# Altium schematic sheet Main.schdoc
size 297 x 209 mm; Symbol: Drawing-Symbol_A4; Company: 嘉立创EDA; Version: V1.0; Page Size: A4; @Project Name: V4.0整合版; @Update Date: 2026-07-27; @Create Date: 2026-07-27; Device: Drawing-Symbol_A4; @Board Name: Board1; @Page Name: P1; @Create Time: 21:20:04; @Page Count: 1; @Page No: 1; @Schematic Name: Schematic1; @Update Time: 21:20:04; @Assembly Variant: Basic; Border: 1; Title Block Position: 3; Size: A4; Width: 1170; Height: 825; Region Start: 1; X Region Count: 6; Y Region Count: 4; Blade Width: 10; Title Block: 0
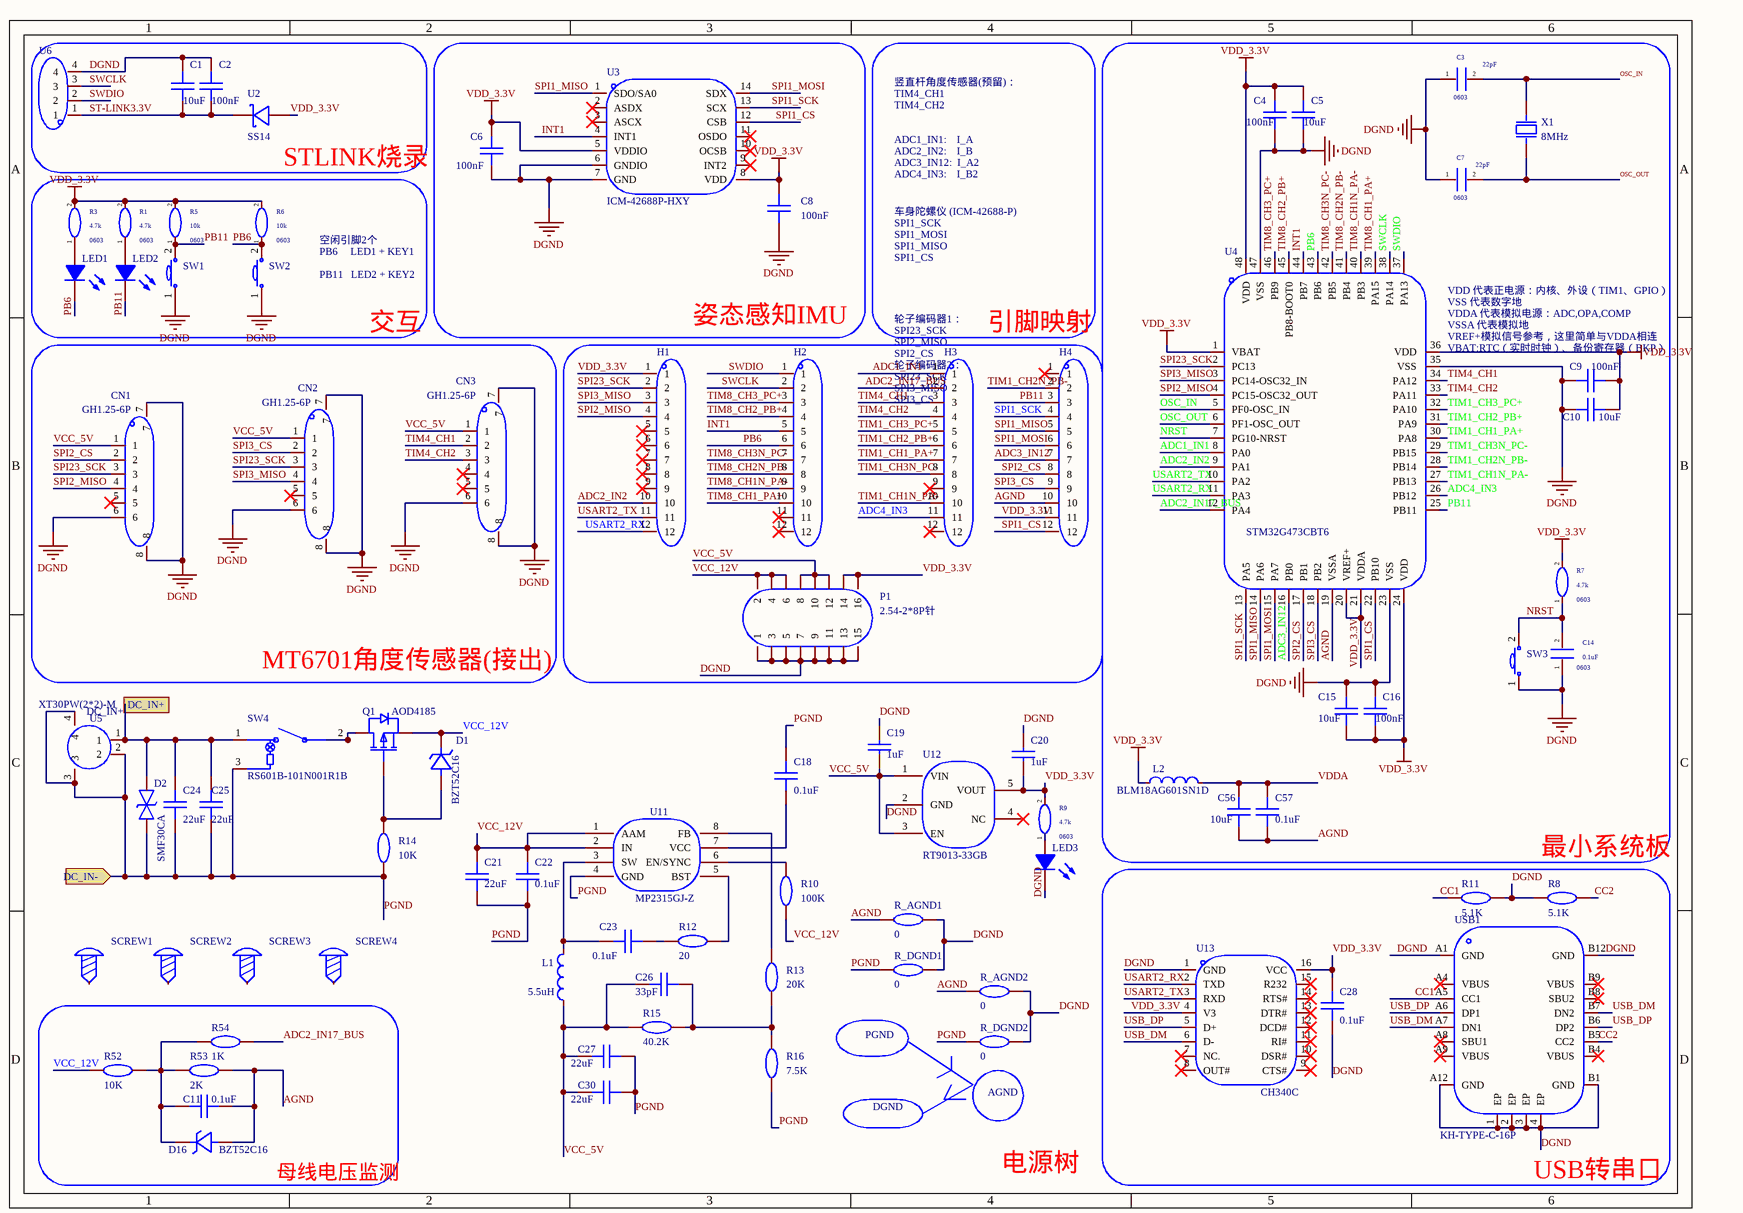
[diagram p0: Main.schdoc]

## Parts
C1  10uF  [C0603]
C2  100nF  [C0603]
C3  value 22pF  Footprint_1: 0603  [C0603]  (hidden comment: My_Library_Cap-0603)
C4  100nF  [C0402]
C5  10uF  [C0402]
C6  100nF  [C0402]
C7  value 22pF  Footprint_1: 0603  [C0603]  (hidden comment: My_Library_Cap-0603)
C8  100nF  [C0402]
C9  100nF  [C0402]
C10  10uF  [C0402]
C11  0.1uF  [C0603]
C14  value 0.1uF  Footprint_1: 0603  [C0603]  (hidden comment: My_Library_Cap-0603)
C15  10uF  [C0402]
C16  100nF  [C0402]
C18  0.1uF  [C0603]
C19  1uF  [C0603]
C20  1uF  [C0603]
C21  22uF  [C0603]
C22  0.1uF  [C0603]
C23  0.1uF  [C0603]
C24  22uF  [C0603]
C25  22uF  [C0603]
C26  33pF  [C0603]
C27  22uF  [C0805]
C28  0.1uF  [C0603]
C30  22uF  [C0805]
C56  10uF  [C0603]
C57  0.1uF  [C0603]
CN1  GH1.25-6P  [CONN-SMD_GH1.25-6P]
CN2  GH1.25-6P  [CONN-SMD_GH1.25-6P]
CN3  GH1.25-6P  [CONN-SMD_GH1.25-6P]
D1  BZT52C16  [SOD-123_L2.7-W1.6-LS3.7-RD]
D2  SMF30CA  [SOD-123_L2.7-W1.8-LS3.7-BI]
D16  BZT52C16  [SOD-123_L2.7-W1.6-LS3.7-RD]
H1  PZ254V-11-12P  [HDR-TH_12P-P2.54-V-M]  (value not drawn)
H2  PZ254V-11-12P  [HDR-TH_12P-P2.54-V-M]  (value not drawn)
H3  PZ254V-11-12P  [HDR-TH_12P-P2.54-V-M]  (value not drawn)
H4  PZ254V-11-12P  [HDR-TH_12P-P2.54-V-M]  (value not drawn)
L1  5.5uH  [IND-SMD_L10.5-W10.2-HSB-1050]
L2  BLM18AG601SN1D  [L0603]
LED1  (no value)  [LED_0603]
LED2  (no value)  [LED_0603]
LED3  (no value)  [LED_0603]
P1  2.54-2*8P针  [HDR-TH_16P-P2.54-V-M-R2-C8-S2.54]
Q1  AOD4185  [TO-252-2_L6.6-W6.1-P4.57-LS9.9-BR-CW]
R1  value 4.7k  Footprint_1: 0603  [R0603]  (hidden comment: My_Library_Res-0603)
R3  value 4.7k  Footprint_1: 0603  [R0603]  (hidden comment: My_Library_Res-0603)
R5  value 10k  Footprint_1: 0603  [R0603]  (hidden comment: My_Library_Res-0603)
R6  value 10k  Footprint_1: 0603  [R0603]  (hidden comment: My_Library_Res-0603)
R7  value 4.7k  Footprint_1: 0603  [R0603]  (hidden comment: My_Library_Res-0603)
R8  5.1K  [R0603]
R9  value 4.7k  Footprint_1: 0603  [R0603]  (hidden comment: My_Library_Res-0603)
R10  100K  [R0603]
R11  5.1K  [R0603]
R12  20  [R0603]
R13  20K  [R0603]
R14  10K  [R0603]
R15  40.2K  [R0603]
R16  7.5K  [R0603]
R52  10K  [R0603]
R53  2K  [R0603]
R54  1K  [R0603]
R_AGND1  0  [R0603]
R_AGND2  0  [R0603]
R_DGND1  0  [R0603]
R_DGND2  0  [R0603]
SCREW1  (no value)  [M2螺丝]
SCREW2  (no value)  [M2螺丝]
SCREW3  (no value)  [M2螺丝]
SCREW4  (no value)  [M2螺丝]
SW1  (no value)  [Key_SMD_3x4x2]
SW2  (no value)  [Key_SMD_3x4x2]
SW3  (no value)  [Key_SMD_3x4x2]
SW4  RS601B-101N001R1B  [SW-TH_RS601B-101N011R1B]
U2  SS14  [SOD-323_L1.7-W1.3-LS2.5-RD]
U3  ICM-42688P-HXY  [LGA-14_L3.0-W2.5-P0.50-TL]
U4  STM32G473CBT6  [LQFP-48_L7.0-W7.0-P0.50-LS9.0-BL]
U5  XT30PW(2*2)-M  [CONN-TH_XT30PW-M]
U6  HX PZ2.54-1x4P WZ  [HDR-TH_4P-P2.54-H-M-W10.3]  (value not drawn)
U11  MP2315GJ-Z  [TSOT-23-8_L2.9-W1.6-P0.65-LS2.8-BR]
U12  RT9013-33GB  [SOT-23-5_L3.0-W1.7-P0.95-LS2.8-BL]
U13  CH340C  [SOP-16_L10.0-W3.9-P1.27-LS6.0-BL]
USB1  KH-TYPE-C-16P  [USB-C-SMD_KH-TYPE-C-16P]
X1  8MHz  [CRYSTAL-SMD_L11.5-W4.8-LS12.7]

## Blocks framed on the sheet
STLINK烧录: C1 C2 U2 U6
姿态感知IMU: C6 C8 U3
最小系统板: C3-C5 C7 C9 C10 C14-C16 C56 C57 L2 R7 SW3 U4 X1
交互: LED1 LED2 R1 R3 R5 R6 SW1 SW2
MT6701角度传感器(接出): CN1-CN3
引脚映射: H1-H4 P1
母线电压监测: C11 D16 R52-R54

## Ports
DC_IN+ (in), DC_IN- (in)

## Nets
DGND: C1.2 C2.2 C3.1 C4.1 C5.1 C6.1 C7.1 C8.1 C9.1 C10.1 C14.1 C15.1 C16.1 C19.2 C20.2 C28.2 CN1.6 CN1.7 CN1.8 CN2.6 CN2.7 CN2.8 CN3.6 CN3.7 CN3.8 LED3.1(C) P1.1 P1.3 P1.5 P1.7 P1.9 P1.11 P1.13 P1.15 R8.1 R11.2 R_AGND1.2 R_AGND2.2 R_DGND1.2 R_DGND2.2 SW1.1 SW2.1 SW3.1 U3.6(GNDIO) U3.7(GND) U4.23(VSS) U4.35(VSS) U4.47(VSS) U6.4 U12.2(GND) U13.1(GND) USB1.1(EP) USB1.2(EP) USB1.3(EP) USB1.4(EP) USB1.A1(GND) USB1.A12(GND) USB1.B1(GND) USB1.B12(GND)
VDD_3.3V: C4.2 C5.2 C6.2 C8.2 C9.2 C10.2 C15.2 C16.2 C20.1 C28.1 H1.1 H4.11 L2.1 P1.14 P1.16 R1.2 R3.2 R5.2 R6.2 R7.2 R9.2 U2.2(A) U3.5(VDDIO) U3.8(VDD) U4.1(VBAT) U4.20(VREF+) U4.21(VDDA) U4.24(VDD) U4.36(VDD) U4.48(VDD) U12.5(VOUT) U13.4(V3) U13.16(VCC)
ADC1_IN1: H3.1 U4.8(PA0)
ADC2_IN2: H1.10 U4.9(PA1)
ADC2_IN17_BUS: H3.2 R54.1 U4.12(PA4)
ADC3_IN12: H4.7 U4.16(PB0)
ADC4_IN3: H3.11 U4.26(PB12)
AGND: C11.2 C56.2 C57.2 D16.2(A) H4.10 R53.1 R_AGND1.1 R_AGND2.1 U4.19(VSSA)
CC1: R11.1 USB1.A5(CC1)
CC2: R8.2 USB1.B5(CC2)
DC_IN+: C24.2 C25.2 D2.2 SW4.1 U5.1
INT1: H2.5 U3.4(INT1) U4.44(PB7)
NRST: C14.2 R7.1 SW3.2 U4.7(PG10-NRST)
OSC_IN: C3.2 U4.5(PF0-OSC_IN) X1.1(OSC1)
OSC_OUT: C7.2 U4.6(PF1-OSC_OUT) X1.2(OSC2)
PB6: H2.6 LED1.1(C) R6.1 SW2.2 U4.43(PB6)
PB11: H4.3 LED2.1(C) R5.1 SW1.2 U4.25(PB11)
PGND: C18.1 C21.1 C22.1 C24.1 C25.1 C27.2 C30.2 D2.1 R14.1 R16.1 R_DGND1.1 R_DGND2.1 SW4.3 U5.2 U5.3 U5.4 U11.4(GND) ; port DC_IN-
SPI1_CS: H4.12 U3.12(CSB) U4.22(PB10)
SPI1_MISO: H4.5 U3.1(SDO/SA0) U4.14(PA6)
SPI1_MOSI: H4.6 U3.14(SDX) U4.15(PA7)
SPI1_SCK: H4.4 U3.13(SCX) U4.13(PA5)
SPI2_CS: CN1.2 H4.8 U4.17(PB1)
SPI2_MISO: CN1.4 H1.4 U4.4(PC15-OSC32_OUT)
SPI3_CS: CN2.2 H4.9 U4.18(PB2)
SPI3_MISO: CN2.4 H1.3 U4.3(PC14-OSC32_IN)
SPI23_SCK: CN1.3 CN2.3 H1.2 U4.2(PC13)
ST-LINK3.3V: C1.1 C2.1 U2.1(K) U6.1
SWCLK: H2.2 U4.38(PA14) U6.3
SWDIO: H2.1 U4.37(PA13) U6.2
TIM1_CH1_PA+: H3.7 U4.30(PA8)
TIM1_CH1N_PA-: H3.10 U4.27(PB13)
TIM1_CH2_PB+: H3.6 U4.31(PA9)
TIM1_CH2N_PB-: H4.2 U4.28(PB14)
TIM1_CH3_PC+: H3.5 U4.32(PA10)
TIM1_CH3N_PC-: H3.8 U4.29(PB15)
TIM4_CH1: CN3.2 H3.3 U4.34(PA12)
TIM4_CH2: CN3.3 H3.4 U4.33(PA11)
TIM8_CH1_PA+: H2.10 U4.39(PA15)
TIM8_CH1N_PA-: H2.9 U4.40(PB3)
TIM8_CH2_PB+: H2.4 U4.45(PB8-BOOT0)
TIM8_CH2N_PB-: H2.8 U4.41(PB4)
TIM8_CH3_PC+: H2.3 U4.46(PB9)
TIM8_CH3N_PC-: H2.7 U4.42(PB5)
USART2_RX: H1.12 U4.11(PA3) U13.2(TXD)
USART2_TX: H1.11 U4.10(PA2) U13.3(RXD)
USB_DM: U13.6(D-) USB1.A7(DN1) USB1.B7(DN2)
USB_DP: U13.5(D+) USB1.A6(DP1) USB1.B6(DP2)
VCC_5V: C19.1 C26.1 C27.1 C30.1 CN1.1 CN2.1 CN3.1 L1.1 P1.8 P1.10 P1.12 R15.2 U12.1(VIN) U12.3(EN)
VCC_12V: C21.2 C22.2 D1.1(K) P1.2 P1.4 P1.6 Q1.3(S) R10.2 R52.2 U11.1(AAM) U11.2(IN)
VDDA: C56.1 C57.1 L2.2
NetC11_1: C11.1 D16.1(K) R52.1 R53.2 R54.2
NetC18_2: C18.2 U11.7(VCC)
NetC23_1: C23.1 L1.2 U11.3(SW)
NetC23_2: C23.2 R12.1
NetC26_2: C26.2 R13.1 R15.1 R16.2
NetD1_2: D1.2(A) Q1.1(G) R14.2
NetLED1_2: LED1.2(A) R3.1
NetLED2_2: LED2.2(A) R1.1
NetLED3_2: LED3.2(A) R9.1
NetQ1_2: Q1.2(D) SW4.2
NetR10_1: R10.1 U11.6(EN/SYNC)
NetR12_2: R12.2 U11.5(BST)
NetR13_2: R13.2 U11.8(FB)

Not connected (* = marked no-connect by the designer): CN1 5*; CN2 5*; CN3 4* 5*; H1 5* 6* 7* 8* 9*; H2 11* 12*; H3 9* 12*; H4 1*; SCREW1 1; SCREW2 1; SCREW3 1; SCREW4 1; U3 2(ASDX)* 3(ASCX)* 9(INT2)* 10(OCSB)* 11(OSDO)*; U12 4(NC)*; U13 7(NC.)* 8(OUT#)* 9(CTS#)* 10(DSR#)* 11(RI#)* 12(DCD#)* 13(DTR#)* 14(RTS#)* 15(R232)*; USB1 A4(VBUS)* A8(SBU1)* A9(VBUS)* B4(VBUS)* B8(SBU2)* B9(VBUS)*

## Notes on the sheet
- 竖直杆角度传感器(预留)：
  TIM4_CH1
  TIM4_CH2
- ADC1_IN1:    I_A
  ADC2_IN2:    I_B
  ADC3_IN12:  I_A2
  ADC4_IN3:    I_B2
- (near H3) 车身陀螺仪 (ICM-42688-P)
  SPI1_SCK
  SPI1_MOSI
  SPI1_MISO
  SPI1_CS
- 空闲引脚2个
  PB6     LED1 + KEY1
  PB11   LED2 + KEY2
- VDD 代表正电源：内核、外设（TIM1、GPIO）
  VSS 代表数字地
  VDDA 代表模拟电源：ADC,OPA,COMP
  VSSA 代表模拟地
  VREF+模拟信号参考，这里简单与VDDA相连
  VBAT:RTC（实时时钟）、备份寄存器（BKP）
- (near H3) 轮子编码器1：
  SPI23_SCK
  SPI2_MISO
  SPI2_CS
  轮子编码器2：
  SPI23_SCK
  SPI3_MISO
  SPI3_CS
- PGND
- (near R_DGND2) AGND
- DGND
- 电源树
- (near USB1) USB转串口
- 创建日期
- 2026-07-27
- 原理图
- 板子
- Schematic1
- Board1
- 更新日期
- 图页
- P1
- 绘制
- 审阅
- V4.0整合版
- 版本
- V1.0
- 尺寸
- A4
- 页    1    共    1
- 嘉立创EDA

## Library data of the parts
C1 C2 C4-C6 C8-C11 C15 C16 C18 C21-C26 C56 C57 = CAP_0603: Symbol: Capacitance; 3D Model: ac125912035d415993ca9572d50418b1聨0819f05c4eef4c71ace90d822a990e87; 3D Model Transform: 62.992,31.496,0,0,0,0,0,0,0; ConvertToPcb: yes; ModelName: C0603_L1.6-W0.8-H0.8; Device: CAP_0603; Supplier Footprint: 0603; AddInBom: yes
  C1 C56: Value: 10uF; FootprintName: C0603
  C2: Value: 100nF; FootprintName: C0603
  C4 C6 C8 C9 C16: Value: 100nF; FootprintName: C0402
  C5 C10 C15: Value: 10uF; FootprintName: C0402
  C11 C18 C22 C23 C57: Value: 0.1uF; FootprintName: C0603
  C21 C24 C25: Value: 22uF; FootprintName: C0603
  C26: Value: 33pF; FootprintName: C0603
C3 C7 C14 = My_Library_Cap-0603: Origin Footprint: MyPCBLibrary:C0603; AddInBom: yes; Symbol: My_Library_Cap-0603; Device: My_Library_Cap-0603
C19 C20 = CL10B105KA8NNNC: 容值:1uF;精度:±10%;额定电压:25V;温度系数:X7R;; Manufacturer: SAMSUNG(三星); 3D Model: ac125912035d415993ca9572d50418b1聨0819f05c4eef4c71ace90d822a990e87; 3D Model Transform: 62.992,31.496,0,0,0,0,0,0,0; Tolerance: ±10%; Voltage Rating: 25V; Temperature Coefficient: X7R; AddInBom: yes; ModelName: C0603_L1.6-W0.8-H0.8; Symbol: CL10B105KA8NNNC; Device: CL10B105KA8NNNC; LCSC Part Name: 1uF ±10% 25V; Supplier Part: C29936; Manufacturer Part: CL10B105KA8NNNC; Supplier Footprint: 0603; JLCPCB Part Class: Extended Part; Datasheet: https://item.szlcsc.com/datasheet/CL10B105KA8NNNC/30690.html; Supplier: LCSC; Value: 1uF; ConvertToPcb: yes; FootprintName: C0603
C27 C28 C30 = CAP_0805: Symbol: Capacitance; 3D Model: 1ba041120af144c991958decab20d241聨0819f05c4eef4c71ace90d822a990e87; 3D Model Transform: 78.74,51.181,0,0,0,0,0,0.0005,0; ConvertToPcb: yes; ModelName: C0805_L2.0-W1.3-H1.3; Device: CAP_0805; Supplier Footprint: 0805; AddInBom: yes
  C27 C30: Value: 22uF; FootprintName: C0805
  C28: Value: 0.1uF; FootprintName: C0603
CN1-CN3 = GH1.25-6P: AddInBom: yes; ModelId: 9359f40e5f53415caaa6244a3307f3f9聨0819f05c4eef4c71ace90d822a990e87; ModelTransform: 425.196,194.8815,0,0,0,0,0,-9.646,0; Symbol: GH1.25-6P; Device: GH1.25-6P; LCSC Part Name: GH1.25-6P; SupplierPart: C9900018610; ManufacturerPart: GH1.25-6P; Supplier Footprint: GH1.25-6P; JLCPCB Part Class: Extended Part; Supplier: LCSC; ConvertToPcb: yes; FootprintName: CONN-SMD_GH1.25-6P; ModelName: CONN-SMD_GH1.25-6P
D1 D16 = BZT52C16: 二极管配置:独立式;稳压值(标称值):16V;稳压值(范围):15.3V~17.1V;耗散功率(Pd):500mW;; Manufacturer: Slkor(萨科微); Symbol: BZT52C16_C707145; 3D Model: ad7e39f9e5534b3c96ffdc5532ebb493聨0819f05c4eef4c71ace90d822a990e87; 3D Model Transform: 146.026,62.992,0,180,0,0,0.0005,0,0; Diode Configuration: 独立式; Zener Voltage(Nom): 16V; Reverse Leakage Current (Ir): 100nA; Pd - Power Dissipation: 500mW; Impedance(Zzt): 40Ω; Operating Junction Temperature Range: -65℃~+150℃; AddInBom: yes; ModelName: SOD-123_L2.7-W1.6-H1.4-LS3.7; Device: BZT52C16; LCSC Part Name: 独立式 耐压:16V 电流:0.1uA; Supplier Part: C707145; Manufacturer Part: BZT52C16; Supplier Footprint: SOD-123; JLCPCB Part Class: Extended Part; Datasheet: https://item.szlcsc.com/datasheet/BZT52C16/744267.html; Supplier: LCSC; Zener Voltage(Range): 15.3V~17.1V; ConvertToPcb: yes; FootprintName: SOD-123_L2.7-W1.6-LS3.7-RD
D2 = SMF30CA: 反向截止电压(Vrwm):30V;最大钳位电压:48.4V;峰值脉冲电流(Ipp):4.2A;击穿电压:33.3V;; Manufacturer: AnBon(安邦); Symbol: SMF30CA_C435498; 3D Model: 8576f175c34f41329e79954aa68cc529聨0819f05c4eef4c71ace90d822a990e87; 3D Model Transform: 145.669,70.866,0,0,0,0,0,0,0; Reverse Stand-Off Voltage (Vrwm): 30V; Maximum Clamping Voltage: 48.4V; Peak Pulse Current (Ipp): 4.2A; Breakdown Voltage: 33.3V; Reverse Leakage Current (Ir): 5uA; Type: TVS; AddInBom: yes; Device: SMF30CA; LCSC Part Name: SMF30CA; Supplier Part: C435498; Manufacturer Part: SMF30CA; Supplier Footprint: SOD-123; JLCPCB Part Class: Extended Part; Datasheet: https://atta.szlcsc.com/upload/public/pdf/source/20191009/C435508_DB7B75E48DB0811659B52C5D7F67F4F0.pdf; Supplier: LCSC; ConvertToPcb: yes; FootprintName: SOD-123_L2.7-W1.8-LS3.7-BI; ModelName: SOD-123_L2.7-W1.8-LS3.7-BI
H1 H4 = PZ254V-11-12P: 插针结构:1x12P;间距:2.54mm;行距:-;圆针/方针:方针;安装方式:直插;排数:单排;总PIN位数:12P;额定电流:3A;额定电压:250V;配合针长度:6mm;塑高:2.5mm;端接针长度:3mm;触头材质:-;工作温度:-40℃~+105℃;颜色:黑色;; Manufacturer: XFCN(兴飞); 3D Model: 3dba4cf9b1d14f4b93786901a7682825聨0819f05c4eef4c71ace90d822a990e87; 3D Model Transform: 1199.998,100,0,0,0,0,0,0,-118.11; Pin Structure: 1x12P; Pitch: 2.54mm; Circluar Pins/Square Pins: 方针; Current Rating: 3A; Voltage Rating (Max): 250V; AddInBom: yes; ModelName: HDR2.54-M-LI-1X12P; Symbol: PZ254V-11-12P; Device: PZ254V-11-12P; LCSC Part Name: 1x12P 间距:2.54mm 方针 直插; Supplier Part: C2840012; Manufacturer Part: PZ254V-11-12P; Supplier Footprint: 插件,P=2.54mm; JLCPCB Part Class: Extended Part; Datasheet: https://item.szlcsc.com/datasheet/PZ254V-11-12P/3017606.html; Supplier: LCSC; Row Spacing: -; Mounting Type: 直插; Number of Rows: 单排; Number of Pins: 12P; Length of Mating Pin: 6mm; Insulation Height: 2.5mm; Length of End Connection Pin: 3mm; Contact Material: -; Operating Temperature: -40℃~+105℃; Color: 黑色; ConvertToPcb: yes; FootprintName: HDR-TH_12P-P2.54-V-M
H2 H3 = PZ254V-11-12P: 插针结构:1x12P;间距:2.54mm;行距:-;圆针/方针:方针;安装方式:直插;排数:单排;总PIN位数:12P;额定电流:3A;额定电压:250V;配合针长度:6mm;塑高:2.5mm;端接针长度:3mm;触头材质:-;工作温度:-40℃~+105℃;颜色:黑色;; Manufacturer: XFCN(兴飞); AddInBom: yes; ModelId: 3dba4cf9b1d14f4b93786901a7682825聨0819f05c4eef4c71ace90d822a990e87; ModelName: HDR2.54-M-LI-1X12P; ModelTransform: 1199.998,100,0,0,0,0,0,0,-118.11; Pin Structure: 1x12P; Pitch: 2.54mm; Circluar Pins/Square Pins: 方针; Current Rating: 3A; Voltage Rating (Max): 250V; Symbol: PZ254V-11-12P; Device: PZ254V-11-12P; LCSC Part Name: 1x12P 间距:2.54mm 方针 直插; SupplierPart: C2840012; ManufacturerPart: PZ254V-11-12P; Supplier Footprint: 插件,P=2.54mm; JLCPCB Part Class: Extended Part; Datasheet: https://item.szlcsc.com/datasheet/PZ254V-11-12P/3017606.html; Supplier: LCSC; ConvertToPcb: yes; FootprintName: HDR-TH_12P-P2.54-V-M; Row Spacing: -; Mounting Type: 直插; Number of Rows: 单排; Number of Pins: 12P; Length of Mating Pin: 6mm; Insulation Height: 2.5mm; Length of End Connection Pin: 3mm; Contact Material: -; Operating Temperature: -40℃~+105℃; Color: 黑色
L1 = HSB-1050-5R5-M: 电感值:5.5uH;精度:±20%;额定电流:10A;饱和电流(Isat):12A;; Manufacturer: YOUCHI(佑驰); Tolerance: ±20%; Current Rating: 10A; Current - Saturation(Isat): 12A; DC Resistance(DCR): 10.3mΩ; AddInBom: yes; Symbol: HSB-1050-5R5-M; Device: HSB-1050-5R5-M; LCSC Part Name: 5.5uH  ±20%  12.0A; Supplier Part: C53373579; Manufacturer Part: HSB-1050-5R5-M; Supplier Footprint: SMD,10.5x10.2mm; JLCPCB Part Class: Extended Part; Datasheet: https://item.szlcsc.com/datasheet/HSB-1050-5R5-M/56489689.html; Supplier: LCSC; Value: 5.5uH; ConvertToPcb: yes; FootprintName: IND-SMD_L10.5-W10.2-HSB-1050
L2 = BLM18AG601SN1D: 阻抗@频率:600Ω@100MHz;误差:±25%;直流电阻(DCR):380mΩ;; Manufacturer: muRata(村田); 3D Model: 2bc5ec593d464d6ba9807aec0b5673c2聨0819f05c4eef4c71ace90d822a990e87; 3D Model Transform: 62.992,31.496,0,180,0,0,0.094,0.629,0; Tolerance: ±25%; DC Resistance(DCR): 380mΩ; Current Rating: 500mA; Number of Circuits: 1; AddInBom: yes; ModelName: L0603_L1.6-W0.8-H0.5_BEAD; Symbol: BLM18AG601SN1D; Device: BLM18AG601SN1D; LCSC Part Name: 单路 0603磁珠 阻抗600Ω@100MHz; Supplier Part: C19330; Manufacturer Part: BLM18AG601SN1D; Supplier Footprint: 0603; JLCPCB Part Class: Extended Part; Datasheet: https://item.szlcsc.com/datasheet/BLM18AG601SN1D/20038.html; Supplier: LCSC; Impedance @ Frequency: 600Ω@100MHz; Operating Temperature: -55℃~+125℃; ConvertToPcb: yes; FootprintName: L0603
LED1-LED3 = LED_0603-B: Symbol: LED_B; Convert to PCB: yes; 3D Model: eb8d964598f24248affda46f619856c5聨0819f05c4eef4c71ace90d822a990e87; 3D Model Transform: 63.1,31.6,23.7,0,0,0,0,0,0; ModelName: LED-0603_B; Device: LED_0603-B; Add into BOM: yes; Supplier Footprint: 0603; FootprintName: LED_0603
P1 = 2.54-2*8P针_C68234: 插针结构:2x8P;间距:2.54mm;行距:2.54mm;圆针/方针:方针;安装方式:直插;排数:双排;总PIN位数:16P;额定电流:3A;额定电压:-;配合针长度:5.9mm;塑高:2.54mm;端接针长度:3mm;触头材质:黄铜;触头镀层:金;工作温度:-55℃~+105℃;颜色:黑色;; Manufacturer: BOOMELE(博穆精密); Symbol: Header-Male-2.54_2x8; AddInBom: yes; ModelId: 4229ed04564d49dfa51d40f734d422b6聨0819f05c4eef4c71ace90d822a990e87; ModelName: HDR2.54-M-LI-2X8P; ModelTransform: 799.99844,200,0,0,0,0,0,0,-118.11; Pin Structure: 2x8P; Pitch: 2.54mm; Circluar Pins/Square Pins: 方针; Current Rating: 3A; Device: 2.54-2*8P针_C68234; LCSC Part Name: 2x8P 间距:2.54mm 方针 直插; SupplierPart: C68234; ManufacturerPart: 2.54-2*8P针; Supplier Footprint: 插件,P=2.54mm; JLCPCB Part Class: Extended Part; Datasheet: https://item.szlcsc.com/datasheet/2.54-2*8P%25E9%2592%2588/69336.html; Supplier: LCSC; ConvertToPcb: yes; FootprintName: HDR-TH_16P-P2.54-V-M-R2-C8-S2.54; Row Spacing: 2.54mm; Mounting Type: 直插; Number of Rows: 双排; Number of Pins: 16P; Voltage Rating (Max): -; Length of Mating Pin: 5.9mm; Insulation Height: 2.54mm; Length of End Connection Pin: 3mm; Contact Material: 黄铜; Contact Plating: 金; Operating Temperature: -55℃~+105℃; Color: 黑色
Q1 = AOD4185_C2984007: Manufacturer: ISC(无锡固电); 3D Model: ce57f84d66384067af8a68020b6de06d聨0819f05c4eef4c71ace90d822a990e87; 3D Model Transform: 259.842,390.52442,0,90,0,0,-39.39,0,0; AddInBom: yes; ModelName: TO-252-2L-3P_L6.6-W6.1-H2.3-LS10.1-P4.6; Symbol: AOD4185_C2984007; Device: AOD4185_C2984007; LCSC Part Name: AOD4185; Supplier Part: C2984007; Manufacturer Part: AOD4185; Supplier Footprint: TO-252; JLCPCB Part Class: Extended Part; Supplier: LCSC; ConvertToPcb: yes; FootprintName: TO-252-2_L6.6-W6.1-P4.57-LS9.9-BR-CW
R1 R3 R5-R7 R9 = My_Library_Res-0603: Origin Footprint: MyPCBLibrary:R0603; AddInBom: yes; Symbol: My_Library_Res-0603; Device: My_Library_Res-0603
R8 R10-R16 R52-R54 R_AGND1 R_AGND2 R_DGND1 R_DGND2 = Res_0603: Symbol: 电阻; 3D Model: fc143cca1e79419f9cd78b61e9279f08聨0819f05c4eef4c71ace90d822a990e87; 3D Model Transform: 31.8897,63.7794,0,90,0,0,0,0,0; ConvertToPcb: yes; Device: Res_0603; Supplier Footprint: 0603; AddInBom: yes; FootprintName: R0603; ModelName: R0603
  R8 R11: Value: 5.1K
  R10: Value: 100K
  R12: Value: 20
  R13: Value: 20K
  R14 R52: Value: 10K
  R15: Value: 40.2K
  R16: Value: 7.5K
  R53: Value: 2K
  R54: Value: 1K
  R_AGND1 R_AGND2 R_DGND1 R_DGND2: Value: 0
SCREW1-SCREW4 = M2螺丝: Symbol: 螺丝孔; ConvertToPcb: yes; Device: M2螺丝; AddInBom: yes; Supplier Footprint: 插件; FootprintName: M2螺丝
SW1-SW3 = Key_SMD_3x4x2: Symbol: 轻触按键x2; 3D Model: 63599cce708d48afbce1b0db00354477聨0819f05c4eef4c71ace90d822a990e87; 3D Model Transform: 196.85,114.17,79.13,0,0,0,0,0,0; ConvertToPcb: yes; ModelName: SW-SMD_L4.0-W2.9-H2-LS5.0; Device: Key_SMD_3x4x2; Supplier Footprint: SMD; AddInBom: yes; FootprintName: Key_SMD_3x4x2
SW4 = RS601B-101N001R1B: 带灯:-;引脚样式:焊片;额定电流:6A;额定电压(AC):250V;额定电压(DC):-;电路结构:单刀单掷;工作寿命:1万次;; Manufacturer: HCTL(华灿天禄); AddInBom: yes; ModelId: 7c41611d110e4d3795e593475e88af54聨0819f05c4eef4c71ace90d822a990e87; ModelTransform: 842.738,590.55,0,0,0,0,0.001,0,-275.591; Switch Height: 14.2mm; Actuator Type: 凹面弯曲; Actuator Color: 红色; Current Rating: 6A; Voltage Rating (AC): 250V; Circuit: 单刀单掷; Life: 1万次; Actuator Identifier: - O; Symbol: RS601B-101N001R1B; Device: RS601B-101N001R1B; LCSC Part Name: RS601B-101N001R1B; SupplierPart: C2885786; ManufacturerPart: RS601B-101N001R1B; Supplier Footprint: 插件,21x15mm; JLCPCB Part Class: Extended Part; Datasheet: https://item.szlcsc.com/datasheet/RS601B-101N001R1B/3096688.html; Supplier: LCSC; ConvertToPcb: yes; FootprintName: SW-TH_RS601B-101N011R1B; ModelName: SW-TH_RS601B-101N011R1B; Length: 21mm; Width: 15mm; With Lamp: -; Termination Style: 焊片; Voltage Rating (DC): -; Operating Temperature: -25℃~+85℃
U2 = SS14: Symbol: SS14_C9900017063; 3D Model: 0f2f330c645944df9245ac3c3fec3456聨0819f05c4eef4c71ace90d822a990e87; 3D Model Transform: 98.425,49.2125,0,0,0,0,0,0,0; AddInBom: yes; ModelName: SOD-323_L1.7-W1.3-LS2.5-FD; Device: SS14; LCSC Part Name: SS14; Supplier Part: C9900017063; Manufacturer Part: SS14; Supplier Footprint: SOD-323; JLCPCB Part Class: Extended Part; Supplier: LCSC; ConvertToPcb: yes; FootprintName: SOD-323_L1.7-W1.3-LS2.5-RD
U3 = ICM-42688P-HXY: 传感器类型:IMU;接口类型:I2C；SPI;; Manufacturer: HXY MOSFET(华轩阳电子); 3D Model: 776ff2ca16fe4df1a7cc54b42a3d63a3聨0819f05c4eef4c71ace90d822a990e87; 3D Model Transform: 118.11,98.425,0,0,0,0,-0.005,0.0005,0; Accelerometer Sensing Axis: X,Y,Z; Acceleration Measurement Range (MAX): ±16g; Gyroscope Measurement Range (MAX): ±2000dps; Sensor Type: IMU; Output Bits: 16bit; Voltage - Supply: 1.71V~3.6V; Standby Current: 4uA; AddInBom: yes; ModelName: LGA-14_L2.5-W3.0-H0.9-P0.50; Symbol: ICM-42688P-HXY; Device: ICM-42688P-HXY; LCSC Part Name: 六轴惯性传感器模块; Supplier Part: C46550687; Manufacturer Part: ICM-42688P-HXY; Supplier Footprint: LGA-14(2.5x3); JLCPCB Part Class: Extended Part; Datasheet: https://item.szlcsc.com/datasheet/ICM-42688P-HXY/48681527.html; Supplier: LCSC; Gyroscope Sensing Axis: X,Y,Z; Interface: I2C；SPI; Cache Size: -; Operating Temperature: -40℃~+85℃; ConvertToPcb: yes; FootprintName: LGA-14_L3.0-W2.5-P0.50-TL
U4 = STM32G473CBT6: CPU内核:ARM Cortex-M4;CPU最大主频:170MHz;CPU位数:32 Bit;; Manufacturer: ST(意法半导体); 3D Model: 093be70396ff421eb2cdb946d5311efc聨0819f05c4eef4c71ace90d822a990e87; 3D Model Transform: 354.331,354.331,0,0,0,0,0,0,0; CPU Maximum Speed: 170MHz; Core Size: 32 Bit; Program Storage Size: 128KB; Program Memory Type: FLASH; Number of I/O: 38; Oscillator Type: 内置+外置; Voltage - Supply: 1.71V~3.6V; AddInBom: yes; ModelName: LQFP-48_L7.0-W7.0-H1.4-LS9.0-P0.50; Symbol: STM32G473CBT6; Device: STM32G473CBT6; LCSC Part Name: 带DSP和FPU的170MHz主流ARM Cortex-M4 MCU，具有128 KB Flash存储器、数学加速器和高模拟电平集成; Supplier Part: C730111; Manufacturer Part: STM32G473CBT6; Supplier Footprint: LQFP-48(7x7); JLCPCB Part Class: Extended Part; Datasheet: https://item.szlcsc.com/datasheet/STM32G473CBT6/778066.html; Supplier: LCSC; CPU Core: ARM Cortex-M4; RAM Size: 128KB; EEPROM: -; Operating Temperature: -40℃~+85℃; ConvertToPcb: yes; FootprintName: LQFP-48_L7.0-W7.0-P0.50-LS9.0-BL
U5 = XT30PW(2*2)-M: AddInBom: yes; ModelId: 722652c2597f41cd937322584dc4b29b聨0819f05c4eef4c71ace90d822a990e87; ModelTransform: 523.621,549.2115,0,0,0,0,-0.005,-39.568,-78.74; Symbol: XT30PW(2*2)-M; Device: XT30PW(2*2)-M; LCSC Part Name: XT30PW(2*2)-M; SupplierPart: C9900097120; ManufacturerPart: XT30PW(2*2)-M; Supplier Footprint: XT30PW(2*2)-M; JLCPCB Part Class: Extended Part; Supplier: LCSC; ConvertToPcb: yes; FootprintName: CONN-TH_XT30PW-M; ModelName: CONN-TH_XT30PW-M
U6 = HX PZ2.54-1x4P WZ: 插针结构:1x4P;间距:2.54mm;行距:-;圆针/方针:方针;安装方式:弯插;排数:单排;总PIN位数:4P;额定电流:3A;额定电压:1kV;配合针长度:6mm;塑高:2.5mm;端接针长度:3mm;触头材质:黄铜;触头镀层:金;工作温度:-40℃~+105℃;颜色:黑色;; Manufacturer: hanxia(韩下); AddInBom: yes; ModelId: 380738e2c3344fc1a10fb2457d15d466聨0819f05c4eef4c71ace90d822a990e87; ModelTransform: 400.003,407.873,0,180,0,0,0,191.299,-118.11; Pin Structure: 1x4P; Pitch: 2.54mm; Circluar Pins/Square Pins: 方针; Current Rating: 3A; Voltage Rating (Max): 1kV; Symbol: HX PZ2.54-1X4P WZ; Device: HX PZ2.54-1x4P WZ; LCSC Part Name: 1x4P 间距:2.54mm 方针 弯插; SupplierPart: C32713263; ManufacturerPart: HX PZ2.54-1x4P WZ; Supplier Footprint: 弯插,P=2.54mm; JLCPCB Part Class: Extended Part; Datasheet: https://item.szlcsc.com/datasheet/HX%2520PZ2.54-1x4P%2520WZ/34444543.html; Supplier: LCSC; ConvertToPcb: yes; FootprintName: HDR-TH_4P-P2.54-H-M-W10.3; ModelName: HDR-TH_4P-P2.54-H-M-W10.3; Row Spacing: -; Mounting Type: 弯插; Number of Rows: 单排; Number of Pins: 4P; Length of Mating Pin: 6mm; Insulation Height: 2.5mm; Length of End Connection Pin: 3mm; Contact Material: 黄铜; Contact Plating: 金; Operating Temperature: -40℃~+105℃; Color: 黑色; Supplementary Features: -
U11 = MP2315GJ-Z: 功能类型:降压型;工作电压:4.5V~24V;输出电压:800mV~22.8V;输出电流:3A;输出类型:可调;; Manufacturer: MPS(芯源); 3D Model: a4a866e84c1d4e21a00dbb6d6e7ebbb6聨0819f05c4eef4c71ace90d822a990e87; 3D Model Transform: 110.45568,114.173,0,180,0,0,0,0,0; Function: 降压型; Output Current: 3A; Frequency - Switching: 500kHz; Synchronous Rectifier: 是; Number of Outputs: 1; Topology: 降压式; Quiescent Current: 180uA; Switch tube (built-in/external): 内置; Output Type: 可调; AddInBom: yes; Symbol: MP2315GJ-Z; Device: MP2315GJ-Z; LCSC Part Name: 降压型 3A 4.5V~24V; Supplier Part: C45889; Manufacturer Part: MP2315GJ-Z; Supplier Footprint: TSOT-23-8; JLCPCB Part Class: Extended Part; Datasheet: https://item.szlcsc.com/datasheet/MP2315GJ-Z/46892.html; Supplier: LCSC; Voltage - Supply: 4.5V~24V; Output Voltage: 800mV~22.8V; Operating Temperature: -40℃~+125℃; Features: 轻载高效模式；内置LDO稳压器；频率同步；逐波限流；过流保护；打嗝限流; ConvertToPcb: yes; FootprintName: TSOT-23-8_L2.9-W1.6-P0.65-LS2.8-BR; ModelName: TSOT-23-8_L2.9-W1.6-P0.65-LS2.8-BR
U12 = RT9013-33GB: 输出极性:正极;工作电压:5.5V;输出电压:3.3V;输出电流:500mA;电源纹波抑制比(PSRR):50dB@(10kHz);输出类型:固定;; Manufacturer: RICHTEK(立锜); 3D Model: 0a2a1b8f50944f73965918ad6e5fe167聨0819f05c4eef4c71ace90d822a990e87; 3D Model Transform: 118.60433,114.173,0,90,0,0,0.0005,0.0005,0; Output Configuration: 正极; Voltage - Supply: 5.5V; Output Voltage: 3.3V; Output Current: 500mA; Voltage Dropout: 400mV@(500mA); standby current: 25uA; Noise: 30uVrms; Output Type: 固定; Number of Outputs: 1; AddInBom: yes; ModelName: SOT-23-5_L2.9-W1.6-H1.1-LS2.8-P0.95; Symbol: RT9013-33GB; Device: RT9013-33GB; LCSC Part Name: 3.3V 500mA 5.5V; Supplier Part: C47773; Manufacturer Part: RT9013-33GB; Supplier Footprint: SOT-23-5; JLCPCB Part Class: Extended Part; Datasheet: https://item.szlcsc.com/datasheet/RT9013-33GB/48778.html; Supplier: LCSC; Power Supply Rejection Ratio (PSRR): 50dB@(10kHz); Features: 使能控制；短路保护；过流保护；热关断; Operating Temperature: -40℃~+125℃@(Tj); ConvertToPcb: yes; FootprintName: SOT-23-5_L3.0-W1.7-P0.95-LS2.8-BL
U13 = CH340C: 应用功能:收发器;USB协议版本:USB 2.0;通道数:-;数据速率:2Mbps;; Manufacturer: WCH(南京沁恒); 3D Model: 3361a6792abf4a8f8fbca4f1924a67ee聨0819f05c4eef4c71ace90d822a990e87; 3D Model Transform: 240.39054,393.7,0,90,0,0,0,0,0; Applications Function: 收发器; USB Protocol: USB 2.0; Voltage - Supply: 3.3V；5V; Data Rate: 2Mbps; Current - Supply: 7mA; Quiescent Supply Current: 50uA; AddInBom: yes; ModelName: SOP-16_L9.9-W3.9-H1.5-LS6.0-P1.27; Symbol: CH340C; Device: CH340C; LCSC Part Name: USB转串口芯片; Supplier Part: C84681; Manufacturer Part: CH340C; Supplier Footprint: SOP-16; JLCPCB Part Class: Extended Part; Datasheet: https://item.szlcsc.com/datasheet/CH340C/85852.html; Supplier: LCSC; Number of Channels: -; Operating Temperature: -20℃~+70℃; Features: 可编程波特率；内置时钟发生器；上电复位; ConvertToPcb: yes; FootprintName: SOP-16_L10.0-W3.9-P1.27-LS6.0-BL
USB1 = KH-TYPE-C-16P: 连接器类型:Type-C;协议标准:-;公母:母;安装方式:卧贴;触点数量:16P;端口数量:1;额定电流 - 电源:3A;工作温度:-40℃~+85℃;; Manufacturer: kinghelm(金航标); 3D Model: f2c381012fbf47e0b76dea5162270f01聨0819f05c4eef4c71ace90d822a990e87; 3D Model Transform: 351.9678,307.48,0,0,0,0,0,-45.276,-43.307; Connector Type: Type-C; Gender: 母; Number of Contacts: 16P; Number of Ports: 1; Current Rating-Power: 3A; Voltage Rating: 30V; Connect-Disconnect Life: 1万次; AddInBom: yes; Symbol: KH-TYPE-C-16P; Device: KH-TYPE-C-16P; LCSC Part Name: Type-C 母 卧贴; Supplier Part: C709357; Manufacturer Part: KH-TYPE-C-16P; Supplier Footprint: SMD; JLCPCB Part Class: Extended Part; Datasheet: https://item.szlcsc.com/datasheet/KH-TYPE-C-16P/747093.html; Supplier: LCSC; Protocol Standard: -; Mounting Type: 卧贴; Length: 7.81mm; Operating Temperature: -40℃~+85℃; ConvertToPcb: yes; FootprintName: USB-C-SMD_KH-TYPE-C-16P; ModelName: USB-C-SMD_KH-TYPE-C-16P
X1 = X49SM8MSD2SC: 晶振类型:贴片晶振;频率:8MHz;常温频差:±20ppm;负载电容:20pF;频率稳定度:±30ppm;; Manufacturer: YXC(扬兴晶振); 3D Model: 6f569b91267b44029b8615eb5c810fba聨0819f05c4eef4c71ace90d822a990e87; 3D Model Transform: 499.999,188.976,0,180,0,0,0.002,-0.002,0; Normal temperature Frequency Tolerance: ±20ppm; Load Capacitance: 20pF; Frequency Stability: ±30ppm; AddInBom: yes; ModelName: HC-49S_L11.4-W1.8-H3.0-LS12.7; Symbol: X49SM8MSD2SC; Device: X49SM8MSD2SC; LCSC Part Name: HC-49SMD 8MHZ 20PF ±20PPM -20~70℃（±30PPM）; Supplier Part: C12674; Manufacturer Part: X49SM8MSD2SC; Supplier Footprint: HC-49S-SMD; JLCPCB Part Class: Basic Part; Datasheet: https://item.szlcsc.com/datasheet/X49SM8MSD2SC/13310.html; Supplier: LCSC; Type: 贴片晶振; Value: 8MHz; Operating Temperature: -20℃~+70℃; ConvertToPcb: yes; FootprintName: CRYSTAL-SMD_L11.5-W4.8-LS12.7